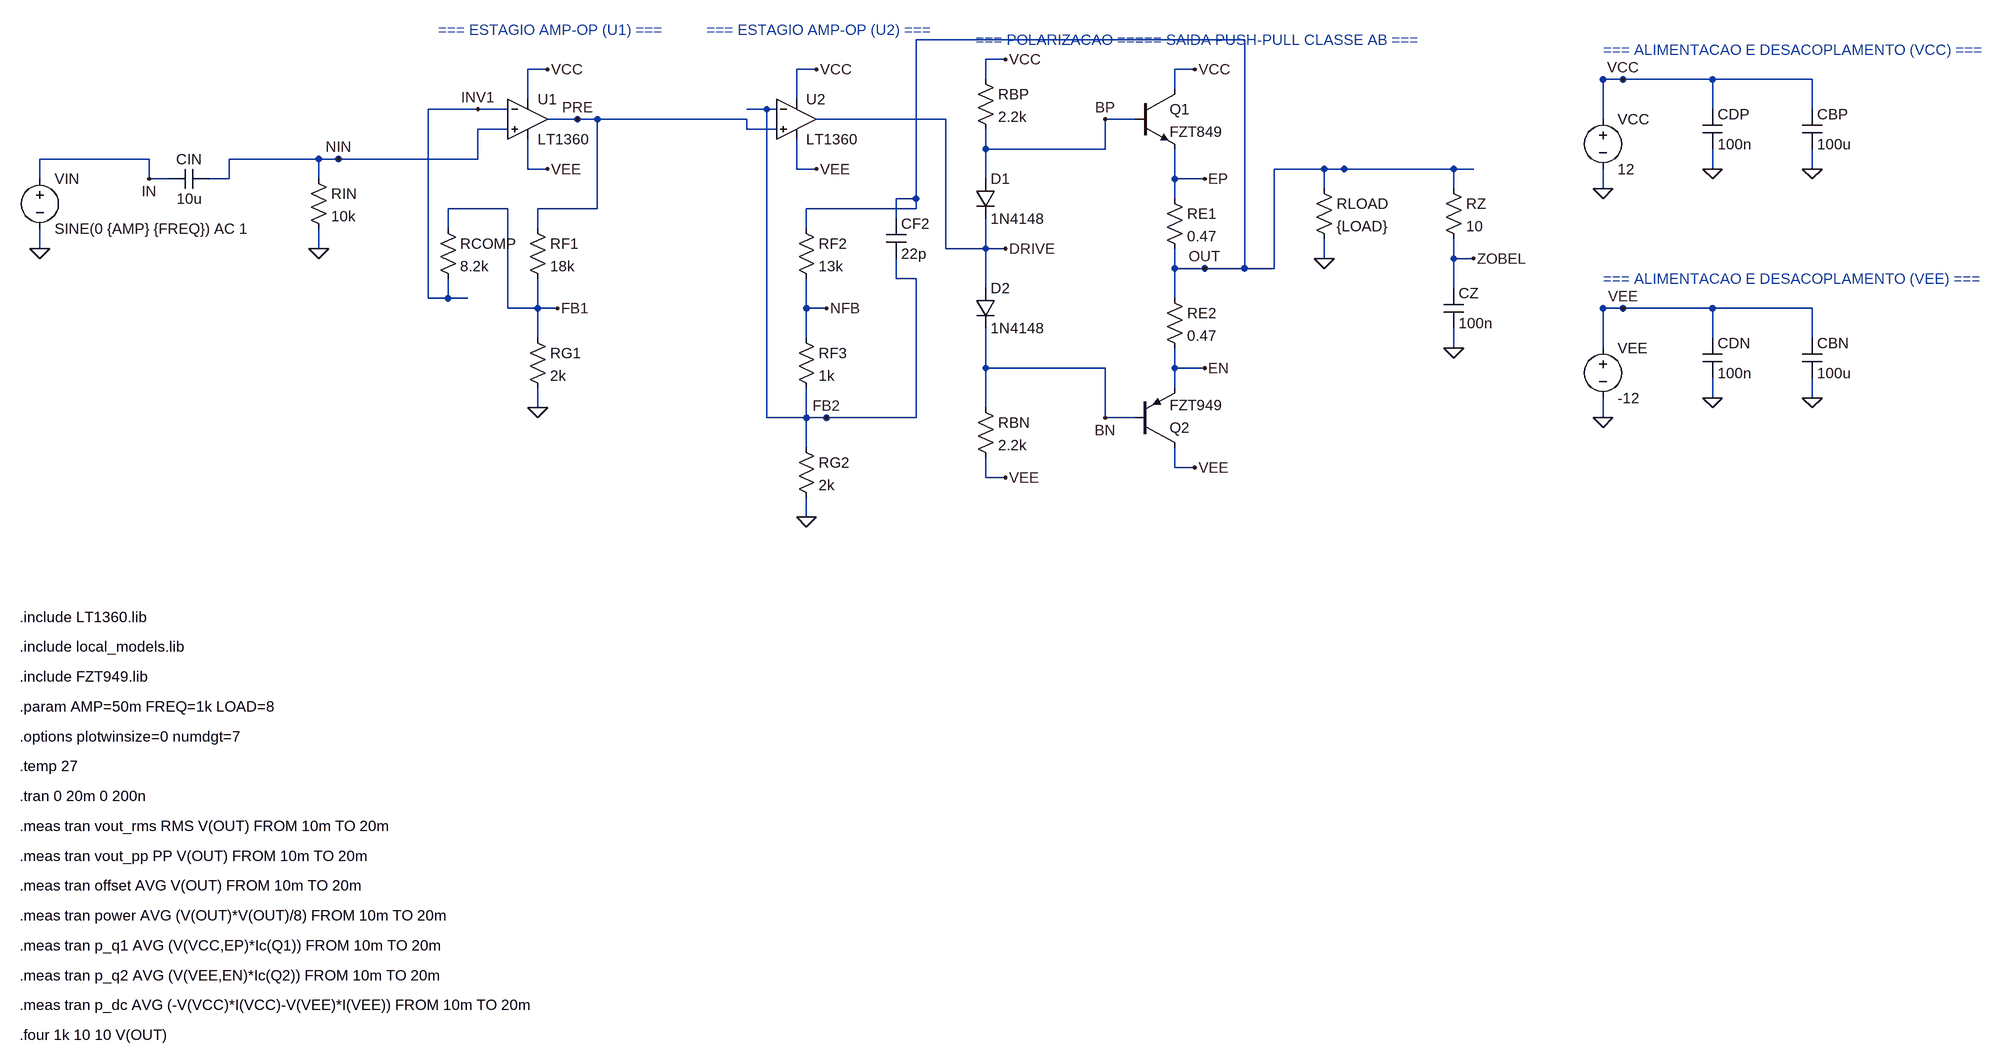
[diagram p0: schematic classe_ab.asc]
classe_ab.asc, the LTspice schematic file:
Version 4
SHEET 1 3744 1808
WIRE 96 368 96 400
WIRE 304 288 272 288
WIRE 368 288 400 288
WIRE 544 288 544 256
WIRE 544 256 576 256
WIRE 544 368 544 400
WIRE 848 208 800 208
WIRE 848 176 800 176
WIRE 880 160 880 112
WIRE 880 112 912 112
WIRE 880 224 880 272
WIRE 880 272 912 272
WIRE 912 192 960 192
WIRE 896 368 896 336
WIRE 896 336 928 336
WIRE 896 448 896 544
WIRE 896 496 928 496
WIRE 896 624 896 656
WIRE 752 368 752 336
WIRE 752 336 784 336
WIRE 752 448 752 480
WIRE 752 480 784 480
WIRE 1280 208 1232 208
WIRE 1280 176 1232 176
WIRE 1312 160 1312 112
WIRE 1312 112 1344 112
WIRE 1312 224 1312 272
WIRE 1312 272 1344 272
WIRE 1344 192 1392 192
WIRE 1328 368 1328 336
WIRE 1328 336 1360 336
WIRE 1328 448 1328 544
WIRE 1328 496 1360 496
WIRE 1328 624 1328 720
WIRE 1328 672 1360 672
WIRE 1328 800 1328 832
WIRE 1472 352 1472 320
WIRE 1472 320 1504 320
WIRE 1472 416 1472 448
WIRE 1472 448 1504 448
WIRE 1616 128 1616 96
WIRE 1616 96 1648 96
WIRE 1616 208 1616 288
WIRE 1616 240 1648 240
WIRE 1616 352 1616 464
WIRE 1616 400 1648 400
WIRE 1616 528 1616 656
WIRE 1616 592 1648 592
WIRE 1616 736 1616 768
WIRE 1616 768 1648 768
WIRE 1920 144 1920 112
WIRE 1920 112 1952 112
WIRE 1856 192 1808 192
WIRE 1920 240 1920 320
WIRE 1920 288 1968 288
WIRE 1920 400 1920 480
WIRE 1920 432 1968 432
WIRE 1920 560 1920 624
WIRE 1920 592 1968 592
WIRE 1856 672 1808 672
WIRE 1920 720 1920 752
WIRE 1920 752 1952 752
WIRE 2160 304 2160 272
WIRE 2160 272 2192 272
WIRE 2160 384 2160 416
WIRE 2368 304 2368 272
WIRE 2368 272 2400 272
WIRE 2368 384 2368 464
WIRE 2368 416 2400 416
WIRE 2368 528 2368 560
WIRE 2608 192 2608 128
WIRE 2608 272 2608 304
WIRE 2784 176 2784 128
WIRE 2784 240 2784 272
WIRE 2944 176 2944 128
WIRE 2944 240 2944 272
WIRE 2608 128 2944 128
WIRE 2608 128 2640 128
WIRE 2608 560 2608 496
WIRE 2608 640 2608 672
WIRE 2784 544 2784 496
WIRE 2784 608 2784 640
WIRE 2944 544 2944 496
WIRE 2944 608 2944 640
WIRE 2608 496 2944 496
WIRE 2608 496 2640 496
WIRE 96 288 96 256
WIRE 96 256 128 256
WIRE 128 256 272 256
WIRE 272 256 272 288
WIRE 1648 240 1808 240
WIRE 1808 240 1808 192
WIRE 1648 592 1808 592
WIRE 1808 592 1808 672
WIRE 784 336 848 336
WIRE 848 336 848 496
WIRE 848 496 928 496
WIRE 784 480 720 480
WIRE 720 480 720 176
WIRE 720 176 800 176
WIRE 928 336 992 336
WIRE 992 336 992 192
WIRE 992 192 960 192
WIRE 960 192 1232 192
WIRE 1232 192 1232 208
WIRE 1392 192 1552 192
WIRE 1552 192 1552 400
WIRE 1552 400 1648 400
WIRE 400 288 400 256
WIRE 400 256 576 256
WIRE 576 256 800 256
WIRE 800 256 800 208
WIRE 1232 176 1264 176
WIRE 1264 176 1264 672
WIRE 1264 672 1360 672
WIRE 1360 672 1504 672
WIRE 1504 672 1504 448
WIRE 1360 336 1504 336
WIRE 1504 336 1504 320
WIRE 1504 320 1504 64
WIRE 1504 64 2032 64
WIRE 2032 64 2032 432
WIRE 2032 432 1968 432
WIRE 1968 432 2080 432
WIRE 2080 432 2080 272
WIRE 2080 272 2192 272
WIRE 2192 272 2400 272
FLAG 96 400 0
FLAG 272 288 IN
FLAG 576 256 NIN
FLAG 544 400 0
FLAG 800 176 INV1
FLAG 912 112 VCC
FLAG 912 272 VEE
FLAG 960 192 PRE
FLAG 928 496 FB1
FLAG 896 656 0
FLAG 1344 112 VCC
FLAG 1344 272 VEE
FLAG 1360 496 NFB
FLAG 1360 672 FB2
FLAG 1328 832 0
FLAG 1648 96 VCC
FLAG 1648 400 DRIVE
FLAG 1648 768 VEE
FLAG 1952 112 VCC
FLAG 1808 192 BP
FLAG 1968 288 EP
FLAG 1968 432 OUT
FLAG 1968 592 EN
FLAG 1808 672 BN
FLAG 1952 752 VEE
FLAG 2160 416 0
FLAG 2400 416 ZOBEL
FLAG 2368 560 0
FLAG 2608 304 0
FLAG 2784 272 0
FLAG 2944 272 0
FLAG 2640 128 VCC
FLAG 2608 672 0
FLAG 2784 640 0
FLAG 2944 640 0
FLAG 2640 496 VEE
SYMBOL voltage 96 272 R0
WINDOW 3 24 96 Left 2
SYMATTR InstName VIN
SYMATTR Value SINE(0 {AMP} {FREQ}) AC 1
SYMBOL cap 368 272 R90
WINDOW 0 0 32 VBottom 2
WINDOW 3 32 32 VTop 2
SYMATTR InstName CIN
SYMATTR Value 10u
SYMBOL res 528 272 R0
SYMATTR InstName RIN
SYMATTR Value 10k
SYMBOL Opamps\LT1360 880 192 R0
SYMATTR InstName U1
SYMATTR Value LT1360
SYMATTR Prefix X
SYMATTR SpiceModel LT1360.lib
SYMATTR Value2 LT1360
SYMBOL res 880 352 R0
SYMATTR InstName RF1
SYMATTR Value 18k
SYMBOL res 880 528 R0
SYMATTR InstName RG1
SYMATTR Value 2k
SYMBOL res 736 352 R0
SYMATTR InstName RCOMP
SYMATTR Value 8.2k
SYMBOL Opamps\LT1360 1312 192 R0
SYMATTR InstName U2
SYMATTR Value LT1360
SYMATTR Prefix X
SYMATTR SpiceModel LT1360.lib
SYMATTR Value2 LT1360
SYMBOL res 1312 352 R0
SYMATTR InstName RF2
SYMATTR Value 13k
SYMBOL res 1312 528 R0
SYMATTR InstName RF3
SYMATTR Value 1k
SYMBOL res 1312 704 R0
SYMATTR InstName RG2
SYMATTR Value 2k
SYMBOL cap 1456 352 R0
SYMATTR InstName CF2
SYMATTR Value 22p
SYMBOL res 1600 112 R0
SYMATTR InstName RBP
SYMATTR Value 2.2k
SYMBOL diode 1600 288 R0
SYMATTR InstName D1
SYMATTR Value 1N4148
SYMBOL diode 1600 464 R0
SYMATTR InstName D2
SYMATTR Value 1N4148
SYMBOL res 1600 640 R0
SYMATTR InstName RBN
SYMATTR Value 2.2k
SYMBOL npn 1856 144 R0
SYMATTR InstName Q1
SYMATTR Value FZT849
SYMBOL res 1904 304 R0
SYMATTR InstName RE1
SYMATTR Value 0.47
SYMBOL res 1904 464 R0
SYMATTR InstName RE2
SYMATTR Value 0.47
SYMBOL pnp 1856 720 M180
SYMATTR InstName Q2
SYMATTR Value FZT949
SYMBOL res 2144 288 R0
SYMATTR InstName RLOAD
SYMATTR Value {LOAD}
SYMBOL res 2352 288 R0
SYMATTR InstName RZ
SYMATTR Value 10
SYMBOL cap 2352 464 R0
SYMATTR InstName CZ
SYMATTR Value 100n
SYMBOL voltage 2608 176 R0
WINDOW 3 24 96 Left 2
SYMATTR InstName VCC
SYMATTR Value 12
SYMBOL cap 2768 176 R0
SYMATTR InstName CDP
SYMATTR Value 100n
SYMBOL cap 2928 176 R0
SYMATTR InstName CBP
SYMATTR Value 100u
SYMBOL voltage 2608 544 R0
WINDOW 3 24 96 Left 2
SYMATTR InstName VEE
SYMATTR Value -12
SYMBOL cap 2768 544 R0
SYMATTR InstName CDN
SYMATTR Value 100n
SYMBOL cap 2928 544 R0
SYMATTR InstName CBN
SYMATTR Value 100u
TEXT 736 48 Left 2 ;=== ESTAGIO AMP-OP (U1) ===
TEXT 1168 48 Left 2 ;=== ESTAGIO AMP-OP (U2) ===
TEXT 1600 64 Left 2 ;=== POLARIZACAO ===
TEXT 1856 64 Left 2 ;=== SAIDA PUSH-PULL CLASSE AB ===
TEXT 2608 80 Left 2 ;=== ALIMENTACAO E DESACOPLAMENTO (VCC) ===
TEXT 2608 448 Left 2 ;=== ALIMENTACAO E DESACOPLAMENTO (VEE) ===
TEXT 64 992 Left 2 !.include LT1360.lib
TEXT 64 1040 Left 2 !.include local_models.lib
TEXT 64 1088 Left 2 !.include FZT949.lib
TEXT 64 1136 Left 2 !.param AMP=50m FREQ=1k LOAD=8
TEXT 64 1184 Left 2 !.options plotwinsize=0 numdgt=7
TEXT 64 1232 Left 2 !.temp 27
TEXT 64 1280 Left 2 !.tran 0 20m 0 200n
TEXT 64 1328 Left 2 !.meas tran vout_rms RMS V(OUT) FROM 10m TO 20m
TEXT 64 1376 Left 2 !.meas tran vout_pp PP V(OUT) FROM 10m TO 20m
TEXT 64 1424 Left 2 !.meas tran offset AVG V(OUT) FROM 10m TO 20m
TEXT 64 1472 Left 2 !.meas tran power AVG (V(OUT)*V(OUT)/8) FROM 10m TO 20m
TEXT 64 1520 Left 2 !.meas tran p_q1 AVG (V(VCC,EP)*Ic(Q1)) FROM 10m TO 20m
TEXT 64 1568 Left 2 !.meas tran p_q2 AVG (V(VEE,EN)*Ic(Q2)) FROM 10m TO 20m
TEXT 64 1616 Left 2 !.meas tran p_dc AVG (-V(VCC)*I(VCC)-V(VEE)*I(VEE)) FROM 10m TO 20m
TEXT 64 1664 Left 2 !.four 1k 10 10 V(OUT)

The netlist it stands for:
* classe_ab.asc
VIN IN 0 SINE(0 {AMP} {FREQ}) AC 1
CIN NIN IN 10u
RIN NIN 0 10k
* U1: LT1360 (symbol Opamps\LT1360 not available, pins judged from their places): In+=NIN In-=INV1 V+=VCC V-=VEE OUT=PRE
RF1 PRE FB1 18k
RG1 FB1 0 2k
RCOMP FB1 INV1 8.2k
* U2: LT1360 (symbol Opamps\LT1360 not available, pins judged from their places): In+=PRE In-=FB2 V+=VCC V-=VEE OUT=DRIVE
RF2 OUT NFB 13k
RF3 NFB FB2 1k
RG2 FB2 0 2k
CF2 OUT FB2 22p
RBP VCC BP 2.2k
D1 BP DRIVE 1N4148
D2 DRIVE BN 1N4148
RBN BN VEE 2.2k
Q1 VCC BP EP 0 FZT849
RE1 EP OUT 0.47
RE2 OUT EN 0.47
Q2 VEE BN EN 0 FZT949
RLOAD OUT 0 {LOAD}
RZ OUT ZOBEL 10
CZ ZOBEL 0 100n
VCC VCC 0 12
CDP VCC 0 100n
CBP VCC 0 100u
VEE VEE 0 -12
CDN VEE 0 100n
CBN VEE 0 100u
.model D D
.lib standard.dio
.model NPN NPN
.model PNP PNP
.lib standard.bjt
* === ESTAGIO AMP-OP (U1) ===
* === ESTAGIO AMP-OP (U2) ===
* === POLARIZACAO ===
* === SAIDA PUSH-PULL CLASSE AB ===
* === ALIMENTACAO E DESACOPLAMENTO (VCC) ===
* === ALIMENTACAO E DESACOPLAMENTO (VEE) ===
.include LT1360.lib
.include local_models.lib
.include FZT949.lib
.param AMP=50m FREQ=1k LOAD=8
.options plotwinsize=0 numdgt=7
.temp 27
.tran 0 20m 0 200n
.meas tran vout_rms RMS V(OUT) FROM 10m TO 20m
.meas tran vout_pp PP V(OUT) FROM 10m TO 20m
.meas tran offset AVG V(OUT) FROM 10m TO 20m
.meas tran power AVG (V(OUT)*V(OUT)/8) FROM 10m TO 20m
.meas tran p_q1 AVG (V(VCC,EP)*Ic(Q1)) FROM 10m TO 20m
.meas tran p_q2 AVG (V(VEE,EN)*Ic(Q2)) FROM 10m TO 20m
.meas tran p_dc AVG (-V(VCC)*I(VCC)-V(VEE)*I(VEE)) FROM 10m TO 20m
.four 1k 10 10 V(OUT)
.lib LT1360.lib
.backanno
.end